# Altium project Industrial_IOT_Dev_Brd-v1.0.PrjPcb (part 7 of 7)
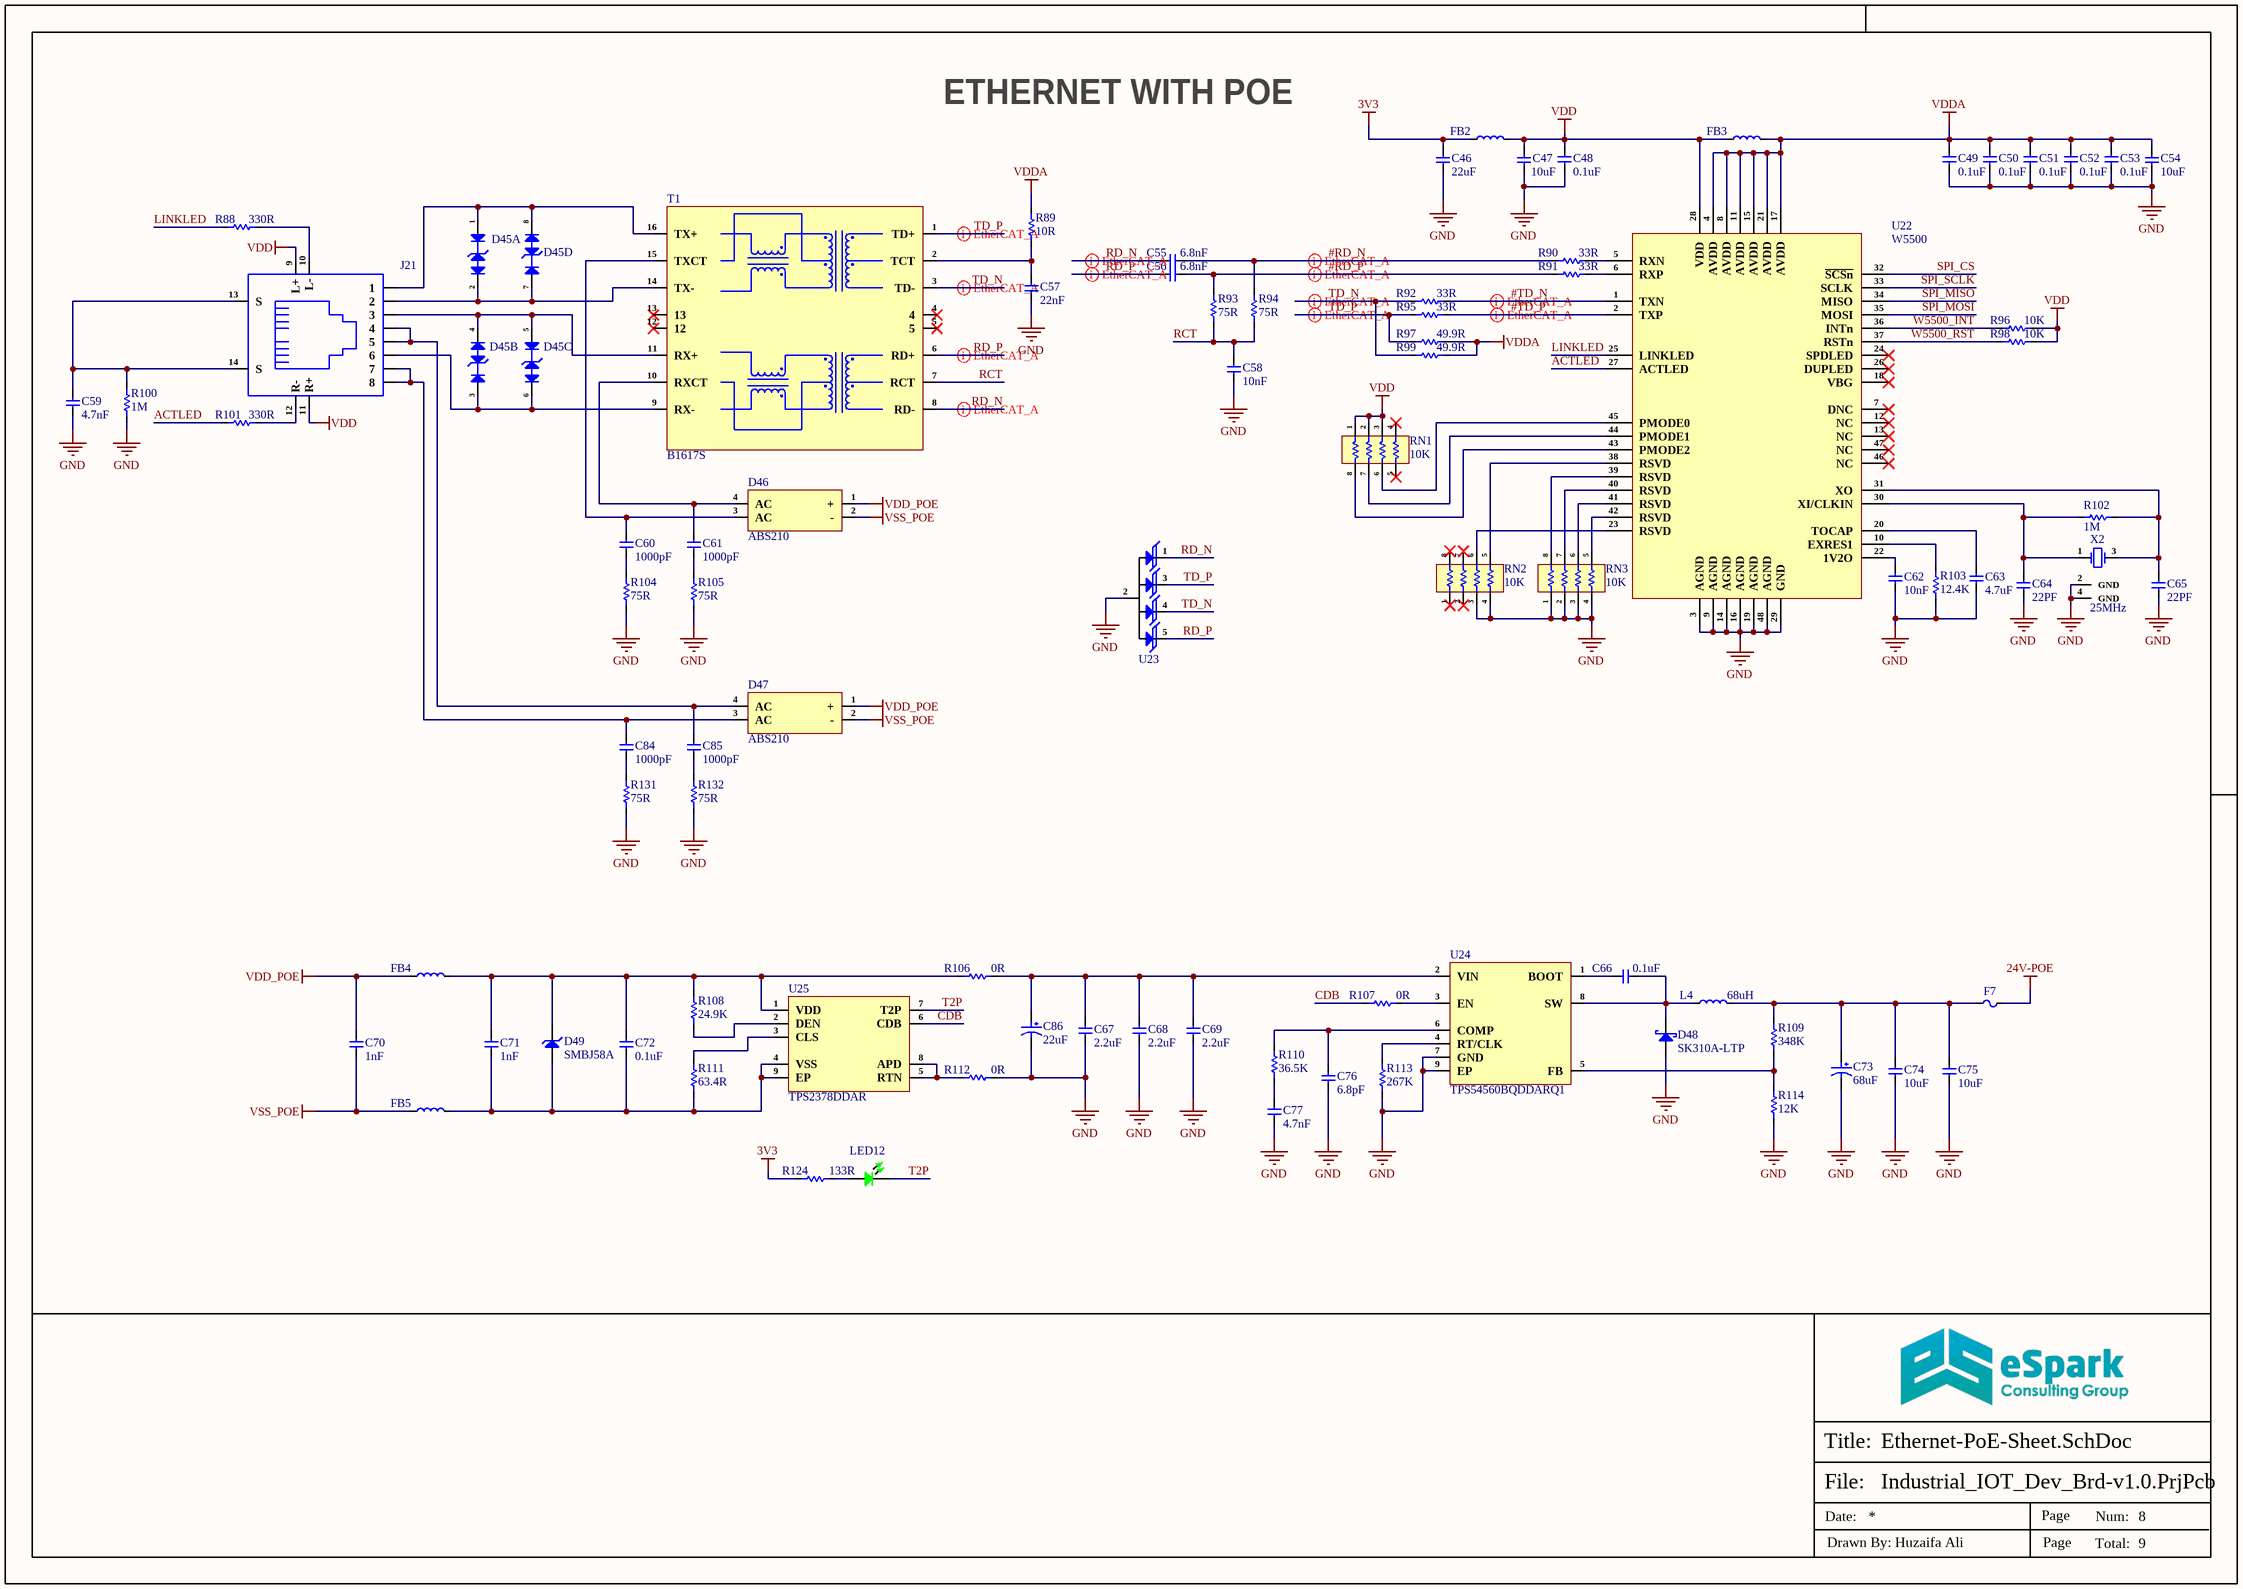
[diagram p12: Ethernet-PoE-Sheet.SchDoc]

## Sheet Ethernet-PoE-Sheet.SchDoc (continued)

### Library data of the parts (continued)
R102 = RK73H1ETTP1004F: Res Thick Film 0402 1M Ohm 1% 0.1W(1/10W) ±100ppm/C Pad SMD Automotive T/R; Manufacturer: KOA Speer; Resistance: 1MR; Power Rating: 63mW; Voltage Rating: 50V; Temperature Coefficient: 100ppm/°C; Max Power Dissipation: 100mW; Item Type: Resistor; Supplier 1: Rs; Manufacturer Part Number: RK73H1ETTP1004F; RoHS: Yes; Category: Chip SMD Resistors; Stock 1: 29500; Pricing 1: 100=0.003, 1000=0.006, 2500=0.005, 5000=0.005, 10000=0.004 (GBP); Mount: Surface Mount; Case/Package: 0402; Case Code (Imperial): 0402; Case Code (Metric): 1005; Min Operating Temperature: -55°C; Max Operating Temperature: 155°C; Packaging: Tape and Reel; Tolerance: 1%; Package Quantity: 10000; Termination: SMD/SMT; Series: RK73H; Construction: Rectangular; Technology: THICK FILM; Features: Moisture Resistant,Automotive AEC-Q200; Number of Terminations: 2; Voltage Rating (DC): 50V; Length: 1mm; Width: 0.5mm; Height: 0.35mm; Depth: 0.5mm; Ratings: AEC-Q200; Military Standard: Not; RoHS Compliant: Yes; Lead Free: 5697LeadFree; ComponentLink1URL: http://www.jameco.com/Jameco/Products/ProdDS/1882463.pdf?src-supplier=Jameco; ComponentLink1Description: http://www.jameco.com/Jameco/Products/ProdDS/1882463.pdf?src-supplier=Jameco; ComponentLink2URL: http://components.arrow.com/part/dataview/39721833S6492602N5146?src-supplier=Arrow+Electronics; ComponentLink2Description: http://components.arrow.com/part/dataview/39721833S6492602N5146?src-supplier=Arrow+Electronics; ComponentLink3URL: https://datasheet.octopart.com/RK73H1ETTP1004F-KOA-Speer-datasheet-149653815.pdf?src-supplier=Farnell; ComponentLink3Description: https://datasheet.octopart.com/RK73H1ETTP1004F-KOA-Speer-datasheet-149653815.pdf?src-supplier=Farnell; ComponentLink4URL: http://www.koaspeer.com/catimages/Products/RK73H/RK73H.pdf?src-supplier=Mouser; ComponentLink4Description: http://www.koaspeer.com/catimages/Products/RK73H/RK73H.pdf?src-supplier=Mouser; ComponentLink5URL: https://www.verical.com/server-webapp/html/getDatasheet?partID=139303&src-supplier=Verical; ComponentLink5Description: https://www.verical.com/server-webapp/html/getDatasheet?partID=139303&src-supplier=Verical; LCSC Part Number: C159943
R103 = RC0603FR-0712K4L: RES SMD 12.4K OHM 1% 1/10W 0603; Manufacturer: Yageo; Resistance: 12.4kR; Power Rating: 100mW; Voltage Rating: 50V; Temperature Coefficient: 100ppm/°C; Working Voltage: 75V; Supplier 1: Digi-Key; Manufacturer Part Number: RC0603FR-0712K4L; RoHS: Yes; Category: Chip SMD Resistors; Stock 1: 494008; Pricing 1: 1=0.10000, 10=0.02400, 100=0.00970, 1000=0.00436, 2500=0.00378 (USD); Case/Package: 0603; Case Code (Metric): 1608; Case Code (Imperial): 0603; Min Operating Temperature: -55°C; Max Operating Temperature: 155°C; Packaging: Tape and Reel; Tolerance: 1%; Package Quantity: 1; Resistor Type: Thick Film; Number of Terminations: 2; Termination: SMD/SMT; Max Power Dissipation: 100mW; Voltage Rating (DC): 50V; Features: Moisture Resistant; Series: RC; Construction: Rectangular; Technology: THICK FILM; Length: 0.063inch; Width: 0.031inch; Height: 0.022inch; Depth: 0.8mm; Military Standard: Not; Lead Free: Lead Free; RoHS Compliant: Yes; ComponentLink1URL: https://datasheet.ciiva.com/2454/pyu-r-int-thick-7-2454069.pdf?src-supplier=Digi-Key; ComponentLink1Description: https://datasheet.ciiva.com/2454/pyu-r-int-thick-7-2454069.pdf?src-supplier=Digi-Key; ComponentLink2URL: https://datasheet.ciiva.com/2454/pyu-r-int-thick-7-2454070.pdf?src-supplier=Digi-Key; ComponentLink2Description: https://datasheet.ciiva.com/2454/pyu-r-int-thick-7-2454070.pdf?src-supplier=Digi-Key; ComponentLink3URL: https://datasheet.ciiva.com/2454/pyu-r-int-thick-7-2454071.pdf?src-supplier=Digi-Key; ComponentLink3Description: https://datasheet.ciiva.com/2454/pyu-r-int-thick-7-2454071.pdf?src-supplier=Digi-Key; Supplier Part Number 1: 311-12.4KHRCT-ND; LCSC Part Number: C137798
R106 R112 = RC0805FR-070RL: RES 0 OHM JUMPER 1/8W 0805; Manufacturer: Yageo; Resistance: 0mR; Tolerance: 1%; Power Rating: 125mW; Item Type: Resistor; Supplier 1: Avnet; Manufacturer Part Number: RC0805FR-070RL; RoHS: Yes; Category: Chip SMD Resistors; Stock 1: 85000; Pricing 1: 5000=0.00281, 10000=0.00277, 20000=0.00269 (USD); Case/Package: 0805; Contact Plating: Tin,Matte; Case Code (Imperial): 0805; Case Code (Metric): 2012; Size Code: 0805; Min Operating Temperature: -55°C; Max Operating Temperature: 155°C; Resistor Type: Thick Film; Packaging: Tape and Reel; Features: Moisture Resistant; Series: RC; Max Power Dissipation: 125mW; Number of Terminations: 2; Construction: Rectangular; Length: 2mm; Depth: 1.25mm; Radiation Hardening: No; Military Standard: Not; Lead Free: Lead Free; RoHS Compliant: Yes; ComponentLink1URL: https://datasheet.ciiva.com/15189/getdatasheetpartid-348154-15189885.pdf?src-supplier=Verical; ComponentLink1Description: https://datasheet.ciiva.com/15189/getdatasheetpartid-348154-15189885.pdf?src-supplier=Verical; ComponentLink2URL: https://datasheet.ciiva.com/17042/rc0805-17042698.pdf?src-supplier=Future+Electronics; ComponentLink2Description: https://datasheet.ciiva.com/17042/rc0805-17042698.pdf?src-supplier=Future+Electronics; Supplier Part Number 1: RC0805FR-070RL; LCSC Part Number: C100045
R107 = RC0402FR-070RL: RES 0 OHM JUMPER 1/16W 0402; Manufacturer: Yageo; Item Type: Resistors; Tolerance: 1%; Power Rating: 62.5mW; Voltage Rating: 50V; Temperature Coefficient: 200ppm/°C; Max Power Dissipation: 63mW; Supplier 1: Mouser; Manufacturer Part Number: RC0402FR-070RL; RoHS: Yes; Stock 1: 8556842; Pricing 1: 1=0.10000, 10=0.01400, 50=0.01400, 100=0.00600, 1000=0.00300, 5000=0.00200, 10000=0.00100 (USD); Mount: Surface Mount; Case/Package: 0402; Contact Plating: Tin,Matte; Case Code (Imperial): 0402; Case Code (Metric): 1005; Size Code: 0402; Min Operating Temperature: -55°C; Max Operating Temperature: 155°C; Resistance: 0R; Resistor Type: Thick Film; Packaging: Tape and Reel; Termination: SMD/SMT; Features: Moisture Resistant; Series: RC; Number of Terminations: 2; Length: 1mm; Width: 0.5mm; Height: 0.35mm; Radiation Hardening: No; Lead Free: Lead Free; RoHS Compliant: Yes; ComponentLink1URL: https://datasheet.ciiva.com/8896/pyu-rc0402-51-rohs-l-6-8896149.pdf?src-supplier=Avnet; ComponentLink1Description: https://datasheet.ciiva.com/8896/pyu-rc0402-51-rohs-l-6-8896149.pdf?src-supplier=Avnet; ComponentLink2URL: https://datasheet.ciiva.com/16790/pyu-rc0402-51-rohs-l-6-r-16790444.pdf?src-supplier=Future+Electronics; ComponentLink2Description: https://datasheet.ciiva.com/16790/pyu-rc0402-51-rohs-l-6-r-16790444.pdf?src-supplier=Future+Electronics; Supplier Part Number 1: 603-RC0402FR-070RL; LCSC Part Number: C106231
R108 = 0603WAF2492T5E: 100mW Thick Film Resistors 75V ±100ppm/℃ ±1% 24.9kΩ 0603 Chip Resistor - Surface Mount ROHS; Manufacturer: UNI-ROYAL(Uniroyal Elec); Manufacturer Part Number: 0603WAF2492T5E; Package: 0603; LCSC Part Number: C25962; Item Type: Resistor; ComponentLink1Description: LCSC; ComponentLink1URL: https://www.lcsc.com/product-detail/Chip-Resistor-Surface-Mount_UNI-ROYAL-Uniroyal-Elec-0603WAF2492T5E_C25962.html
R109 = RT0805BRD07348KL: RES SMD 348K OHM 0.1% 1/8W 0805; Manufacturer: Yageo; Item Type: Resistors; Value: 348kR; Voltage Rating: 150V; Power Rating: 125mW; Temperature Coefficient: 25ppm/°C; Supplier: Digikey; LCSC Part Number: C865416; Manufacturer Part Number: RT0805BRD07348KL; RoHS: Yes; Stock: 10028; Pricing: 1=0.16, 10=0.122, 50=0.0968, 100=0.0867, 500=0.06936, 1000=0.05814 (USD); Case/Package: 0805; Case Code (Metric): 2012; Case Code (Imperial): 0805; Min Operating Temperature: -55°C; Max Operating Temperature: 155°C; Tolerance: 0.1%; Packaging: Tape and Reel; Termination: SMD/SMT; Voltage Rating (DC): 150V; Series: RT; Max Power Dissipation: 125mW; Number of Terminations: 2; Width: 1.25mm; RoHS Compliant: Yes; ComponentLink1URL: https://datasheet.ciiva.com/12705/pyu-rt-1-to-0-05-rohs-l-4-12705227.pdf?src-supplier=Mouser; ComponentLink1Description: https://datasheet.ciiva.com/12705/pyu-rt-1-to-0-05-rohs-l-4-12705227.pdf?src-supplier=Mouser
R110 = RC0603FR-0736K5L: RES 36.5K OHM 1% 1/10W 0603; Manufacturer: YAGEO; Item Type: Resistor; Manufacturer Part Number: RC0603FR-0736K5L; Package: 0603; LCSC Part Number: C137738; ComponentLink1Description: LCSC; ComponentLink1URL: https://www.lcsc.com/product-detail/Chip-Resistor-Surface-Mount_YAGEO-RC0603FR-0736K5L_C137738.html
R111 = AC0603FR-0763R4L: RES SMD 63.4 OHM 1% 1/10W 0603; Manufacturer: Yageo; Item Type: Resistor; Power Rating: 100mW; Voltage Rating: 50V; Temperature Coefficient: 100ppm/°C; Supplier: Digikey; LCSC Part Number: C228004; Manufacturer Part Number: AC0603FR-0763R4L; RoHS: Yes; Stock: 4788; Pricing: 1=0.1, 10=0.021, 50=0.013, 100=0.0108, 500=0.00734, 1000=0.00633 (USD); Case/Package: 0603; Case Code (Imperial): 0603; Case Code (Metric): 1608; Weight: 7.1E-05oz; Min Operating Temperature: -55°C; Max Operating Temperature: 155°C; Tolerance: 1%; Value: 63.4R; Packaging: Tape and Reel; Termination: SMD/SMT; Number of Terminations: 2; Max Power Dissipation: 100mW; Features: Moisture Resistant,Automotive AEC-Q200; Series: AC; Length: 0.063inch; Width: 0.8mm; Height: 0.022inch; RoHS Compliant: Yes; ComponentLink1URL: https://datasheet.ciiva.com/12576/pyu-ac-51-rohs-l-2-12576614.pdf?src-supplier=Mouser; ComponentLink1Description: https://datasheet.ciiva.com/12576/pyu-ac-51-rohs-l-2-12576614.pdf?src-supplier=Mouser
R113 = RT0603BRD07267KL: RES SMD 267K OHM 0.1% 1/10W 0603; Manufacturer: Yageo; Item Type: Resistors; Value: 267kR; Power Rating: 100mW; Voltage Rating: 75V; Temperature Coefficient: 25ppm/°C; Voltage Rating (DC): 50V; Supplier: Digikey; LCSC Part Number: C705753; Manufacturer Part Number: RT0603BRD07267KL; RoHS: Yes; Stock: 12053; Pricing: 1=0.15, 10=0.106, 50=0.0846, 100=0.0755, 500=0.05814, 1000=0.051 (USD); Case/Package: 0603; Case Code (Imperial): 0603; Case Code (Metric): 1608; Weight: 7.1E-05oz; Min Operating Temperature: -55°C; Max Operating Temperature: 155°C; Packaging: Tape and Reel; Tolerance: 0.1%; Termination: SMD/SMT; Series: RT; Max Power Dissipation: 100mW; Number of Terminations: 2; Length: 1.6mm; Width: 0.8mm; Height: 0.45mm; Lead Free: Lead Free; RoHS Compliant: Yes; ComponentLink1URL: http://www.mouser.com/ds/2/447/yageodocoutput-1125656.pdf?src-supplier=Mouser; ComponentLink1Description: http://www.mouser.com/ds/2/447/yageodocoutput-1125656.pdf?src-supplier=Mouser; ComponentLink2URL: http://www.yageo.com/documents/recent/PYu-RT_1-to-0.01_RoHS_L_9.pdf?src-supplier=Digikey; ComponentLink2Description: http://www.yageo.com/documents/recent/PYu-RT_1-to-0.01_RoHS_L_9.pdf?src-supplier=Digikey
R114 = RC0603FR-0712KL: RES 12K OHM 1% 1/10W 0603; Manufacturer: Yageo; Value: 12kR; Power Rating: 100mW; Voltage Rating (DC): 50V; Temperature Coefficient: 100ppm/°C; Item Type: Resistor; Supplier: Future Electronics; Supplier Part Number: 6276984; Manufacturer Part Number: RC0603FR-0712KL; RoHS: Yes; Category: Chip SMD Resistors; Stock: 15340000; Pricing: 5000=0.0028, 75000=0.0015, 100000=0.0026, 250000=0.0014, 375000=0.0025, 750000=0.0013, 1250000=0.0024, 2500000=0.0012, 5000000=0.0022 (USD); Case/Package: 0603; Pins: 2; Case Code (Imperial): 0603; Case Code (Metric): 1608; Min Operating Temperature: -55°C; Max Operating Temperature: 155°C; Tolerance: 1%; Packaging: Tape and Reel; Resistor Type: Thick Film; Voltage Rating: 50V; Termination: SMD/SMT; Number of Terminations: 2; Max Power Dissipation: 100mW; Features: Moisture Resistant; Series: RC; Construction: Rectangular; Resistance Tolerance: 1%; Length: 1.6mm; Width: 0.8mm; Depth: 0.8mm; Reach SVHC Compliant: No; RoHS Compliant: Yes; Lead Free: 5697LeadFree; Military Standard: Not; ComponentLink1URL: https://datasheet.ciiva.com/46412/443971-46412842.pdf?src-supplier=Element14; ComponentLink1Description: https://datasheet.ciiva.com/46412/443971-46412842.pdf?src-supplier=Element14; ComponentLink2URL: https://datasheet.ciiva.com/2454/pyu-r-int-thick-7-2454283.pdf?src-supplier=Digikey; ComponentLink2Description: https://datasheet.ciiva.com/2454/pyu-r-int-thick-7-2454283.pdf?src-supplier=Digikey; ComponentLink3URL: https://datasheet.ciiva.com/2454/pyu-r-int-thick-7-2454284.pdf?src-supplier=Digikey; ComponentLink3Description: https://datasheet.ciiva.com/2454/pyu-r-int-thick-7-2454284.pdf?src-supplier=Digikey; ComponentLink4URL: https://datasheet.ciiva.com/2454/pyu-r-int-thick-7-2454282.pdf?src-supplier=Digikey; ComponentLink4Description: https://datasheet.ciiva.com/2454/pyu-r-int-thick-7-2454282.pdf?src-supplier=Digikey; ComponentLink5URL: https://datasheet.ciiva.com/7746/1784430-7746250.pdf?src-supplier=Element14; ComponentLink5Description: https://datasheet.ciiva.com/7746/1784430-7746250.pdf?src-supplier=Element14; ComponentLink6URL: https://datasheet.ciiva.com/7746/1784430-7746251.pdf?src-supplier=Element14; ComponentLink6Description: https://datasheet.ciiva.com/7746/1784430-7746251.pdf?src-supplier=Element14; LCSC Part Number: C114659
R124 = RC0402FR-07133RL: RES 133 OHM 1% 1/16W 0402; Manufacturer: Yageo; Temperature Coefficient: 100ppm/°C; Power Rating: 62.5mW; Voltage Rating: 50V; Max Power Dissipation: 63mW; Supplier 1: Mouser; Manufacturer Part Number: RC0402FR-07133RL; RoHS: Yes; Category: Chip SMD Resistors; Stock 1: 12475; Pricing 1: 1=0.10000, 10=0.01200, 50=0.01200, 100=0.00500, 1000=0.00300, 2500=0.00200, 10000=0.00100 (USD); Case/Package: 0402; Contact Plating: Tin,Matte; Case Code (Imperial): 0402; Case Code (Metric): 1005; Size Code: 0402; Min Operating Temperature: -55°C; Max Operating Temperature: 155°C; Tolerance: 1%; Resistance: 133R; Resistor Type: Thick Film; Packaging: Tape and Reel; Number of Terminations: 2; Termination: SMD/SMT; Features: Moisture Resistant; Series: RC; Construction: Rectangular; Length: 1mm; Width: 0.02inch; Height: 0.016inch; Depth: 0.5mm; Military Standard: Not; Lead Free: Lead Free; RoHS Compliant: Yes; ComponentLink1URL: https://datasheet.ciiva.com/8887/pyu-rc0402-51-rohs-l-6-8887451.pdf?src-supplier=Avnet; ComponentLink1Description: https://datasheet.ciiva.com/8887/pyu-rc0402-51-rohs-l-6-8887451.pdf?src-supplier=Avnet; Supplier Part Number 1: 603-RC0402FR-07133RL; LCSC Part Number: C327373
RN1-RN3 = YC164-FR-0710KL: RES ARRAY 4 RES 10K OHM 1206; Manufacturer: Yageo; Tolerance: 1%; Voltage Rating: 50V; Number of Elements: 4; Value: 10kR; Circuit Type: Isolated; Power Per Element: 62.5mW; Temperature Coefficient: 200ppm/°C; Item Type: Resistor Array; Supplier 1: Future Electronics; Manufacturer Part Number: YC164-FR-0710KL; RoHS: Yes; Category: Resistor Arrays; Stock 1: 25000; Pricing 1: 5000=0.0101, 20000=0.0095, 50000=0.0092, 125000=0.0089, 200000=0.0085 (USD); Mounting Technology: Surface Mount; Pins: 8; Case Code (Metric): 3216; Case Code (Imperial): 1206; Min Operating Temperature: -55°C; Max Operating Temperature: 155°C; Packaging: Tape and Reel; Number of Resistors: 4; Number of Circuits: 4; Series: YC164; Resistance Tolerance: 1%; Length: 0.126inch; Width: 0.063inch; Height: 0.028inch; Lead Free: Lead Free; RoHS Compliant: Yes; Reach SVHC Compliant: Unknown; ComponentLink1URL: http://www.farnell.com/datasheets/2167431.pdf?src-supplier=Farnell; ComponentLink1Description: http://www.farnell.com/datasheets/2167431.pdf?src-supplier=Farnell; ComponentLink2URL: https://media.digikey.com/pdf/Data%20Sheets/Yageo%20PDFs/YC102-358,TC122-164_Series_DS.pdf?src-supplier=Digi-Key; ComponentLink2Description: https://media.digikey.com/pdf/Data%20Sheets/Yageo%20PDFs/YC102-358,TC122-164_Series_DS.pdf?src-supplier=Digi-Key; ComponentLink3URL: http://www.farnell.com/datasheets/2167431.pdf?src-supplier=Element14; ComponentLink3Description: http://www.farnell.com/datasheets/2167431.pdf?src-supplier=Element14; ComponentLink4URL: http://www.farnell.com/datasheets/443424.pdf?src-supplier=Element14; ComponentLink4Description: http://www.farnell.com/datasheets/443424.pdf?src-supplier=Element14; ComponentLink5URL: http://www.farnell.com/datasheets/2167431.pdf?src-supplier=Newark; ComponentLink5Description: http://www.farnell.com/datasheets/2167431.pdf?src-supplier=Newark; Supplier Part Number 1: 5054288; LCSC Part Number: C110924
T1 = B1617S: Single port 1:1 100M POE SMD-16P,12.7x7mm Pulse Transformers(LAN) ROHS; Manufacturer: CND-tek; Manufacturer Part Number: B1617S; Package: SMD-16P,12.7x7mm; LCSC Part Number: C507597; Item Type: Transformer; ComponentLink1Description: LCSC; ComponentLink1URL: https://jlcpcb.com/partdetail/cndtek-B1617S/C507597
U22 = W5500: SPI LQFP-48(7x7) Ethernet ICs ROHS; Manufacturer: WIZNET; Item Type: IC; Manufacturer Part Number: W5500; LCSC Part Number: C32843; Package: LQFP-48(7x7); ComponentLink1Description: LCSC; ComponentLink1URL: https://www.lcsc.com/product-detail/Ethernet-ICs_WIZNET-W5500_C32843.html
U23 = SP0504BAHTG: TVS DIODE 5.5VWM 8.5VC SOT23-5; Manufacturer: Littelfuse; Direction: Unidirectional; Value: 30pF; Number of Channels: 4; Polarity: Bidirectional,Unidirectional; Breakdown Voltage: 5.5V; Clamping Voltage: 7.8V; Max Power Dissipation: 225mW; Power Line Protection: No; Leakage Current: 100nA; ESD Protection: Yes; Voltage Rating (DC): 5V; Diode Type: ZENER; Clamping Voltage-Max: 8V; Supplier 1: Future Electronics; Manufacturer Part Number: SP0504BAHTG; RoHS: Yes; Category: TVS Diodes; Stock 1: 1611; Pricing 1: 1=0.78, 15=0.685, 75=0.625, 300=0.575, 1500=0.52 (USD); Mounting Technology: Surface Mount; Case/Package: SOT-23; Pins: 5; Min Operating Temperature: -40°C; Max Operating Temperature: 85°C; Packaging: Tape and Reel; Termination: SMD/SMT; Working Voltage: 5.5V; Number of Unidirectional Channels: 4; Reverse Standoff Voltage: 5.5V; Number of Elements: 4; Peak Pulse Power: 225mW; Max Reverse Leakage Current: 100nA; Power Dissipation: 225mW; Series: SP05, SPA®; Length: 3.05mm; Width: 1.75mm; Height: 1.3mm; Depth: 1.75mm; Radiation Hardening: No; Lead Free: Lead Free; RoHS Compliant: Yes; Reach SVHC Compliant: Unknown; ComponentLink1URL: https://datasheet.ciiva.com/15143/getdatasheetpartid-152299-15143806.pdf?src-supplier=Verical; ComponentLink1Description: https://datasheet.ciiva.com/15143/getdatasheetpartid-152299-15143806.pdf?src-supplier=Verical; ComponentLink2URL: https://datasheet.ciiva.com/4509/sp05x-leadfree-4509638.pdf?src-supplier=Mouser; ComponentLink2Description: https://datasheet.ciiva.com/4509/sp05x-leadfree-4509638.pdf?src-supplier=Mouser; ComponentLink3URL: https://datasheet.ciiva.com/22697/1911798-22697943.pdf?src-supplier=Element14; ComponentLink3Description: https://datasheet.ciiva.com/22697/1911798-22697943.pdf?src-supplier=Element14; ComponentLink4URL: https://datasheet.ciiva.com/8062/littefuse-spa-sp050x-8062425.pdf?src-supplier=Element14; ComponentLink4Description: https://datasheet.ciiva.com/8062/littefuse-spa-sp050x-8062425.pdf?src-supplier=Element14; ComponentLink5URL: https://datasheet.ciiva.com/332/sp05xxba-332619.pdf?src-supplier=Digi-Key; ComponentLink5Description: https://datasheet.ciiva.com/332/sp05xxba-332619.pdf?src-supplier=Digi-Key; ComponentLink6URL: https://datasheet.ciiva.com/332/sp05xxba-332620.pdf?src-supplier=Digi-Key; ComponentLink6Description: https://datasheet.ciiva.com/332/sp05xxba-332620.pdf?src-supplier=Digi-Key; ComponentLink7URL: https://datasheet.ciiva.com/16393/sp05xxba-16393404.pdf?src-supplier=Future+Electronics; ComponentLink7Description: https://datasheet.ciiva.com/16393/sp05xxba-16393404.pdf?src-supplier=Future+Electronics; ComponentLink8URL: https://datasheet.ciiva.com/332/sp05xxba-332621.pdf?src-supplier=Digi-Key; ComponentLink8Description: https://datasheet.ciiva.com/332/sp05xxba-332621.pdf?src-supplier=Digi-Key; ComponentLink9URL: https://datasheet.ciiva.com/1268/526672-1268494.pdf?src-supplier=Element14; ComponentLink9Description: https://datasheet.ciiva.com/1268/526672-1268494.pdf?src-supplier=Element14; Supplier Part Number 1: 3283009; LCSC Part Number: C10675; Item Type: TVS Diode
U24 = TPS54560BQDDARQ1: IC REG BCK SPLIT RAIL ADJ 8SOPWR; Manufacturer: Texas Instruments; Max Supply Voltage: 60V; Min Supply Voltage: 4.5V; Nominal Supply Current: 146uA; Supplier: Mouser; Supplier Part Number: 595-TPS54560BQDDARQ1; Manufacturer Part Number: TPS54560BQDDARQ1; RoHS: Yes; Item Type: IC; Stock: 1171; Pricing: 1=6.41, 10=5.44, 50=5.44, 100=4.7, 1000=3.4, 10000=3.29 (USD); Length: 4.89mm; Width: 3.9mm; Height: 1.7mm; Thickness: 1.48mm; ComponentLink1URL: http://www.ti.com/lit/ds/symlink/tps54560b-q1.pdf?src-supplier=Digikey; ComponentLink1Description: http://www.ti.com/lit/ds/symlink/tps54560b-q1.pdf?src-supplier=Digikey; LCSC Part Number: C2072188
U25 = TPS2378DDAR: IEEE 802.3at PoE High-Power PD interface with AUX Control 8-SO PowerPAD -40 to 85; Manufacturer: Texas Instruments; Item Type: IC; Supplier: Mouser; Supplier Part Number: 595-TPS2378DDAR; Manufacturer Part Number: TPS2378DDAR; RoHS: Yes; Category: Interface ICs; Stock: 2078; Pricing: 1=1.61, 10=1.08, 50=1.08, 100=0.955, 1000=0.801, 10000=0.664 (USD); Width: 3.9mm; Thickness: 1.48mm; Lead Free: 5697LeadFree; ComponentLink1URL: https://datasheet.ciiva.com/6632/tps2378-6632081.pdf?src-supplier=Digikey; ComponentLink1Description: https://datasheet.ciiva.com/6632/tps2378-6632081.pdf?src-supplier=Digikey; ComponentLink2URL: https://datasheet.ciiva.com/26931/getdatasheetpartid-621225-26931136.pdf?src-supplier=Verical; ComponentLink2Description: https://datasheet.ciiva.com/26931/getdatasheetpartid-621225-26931136.pdf?src-supplier=Verical; LCSC Part Number: C337500
X2 = X322525MRB4SI: 25MHz 贴片晶振 18pF ±10ppm ±20ppm SMD3225-4P Crystals ROHS; Manufacturer: YXC; Supplier: LCSC; LCSC Part Number: C70593; Manufacturer Part Number: X322525MRB4SI; RoHS: No; Item Type: Crystal

## Sheet RS485-Sheet.SchDoc
size 420 x 297 mm; SheetNumber: 9; SheetTotal: 9
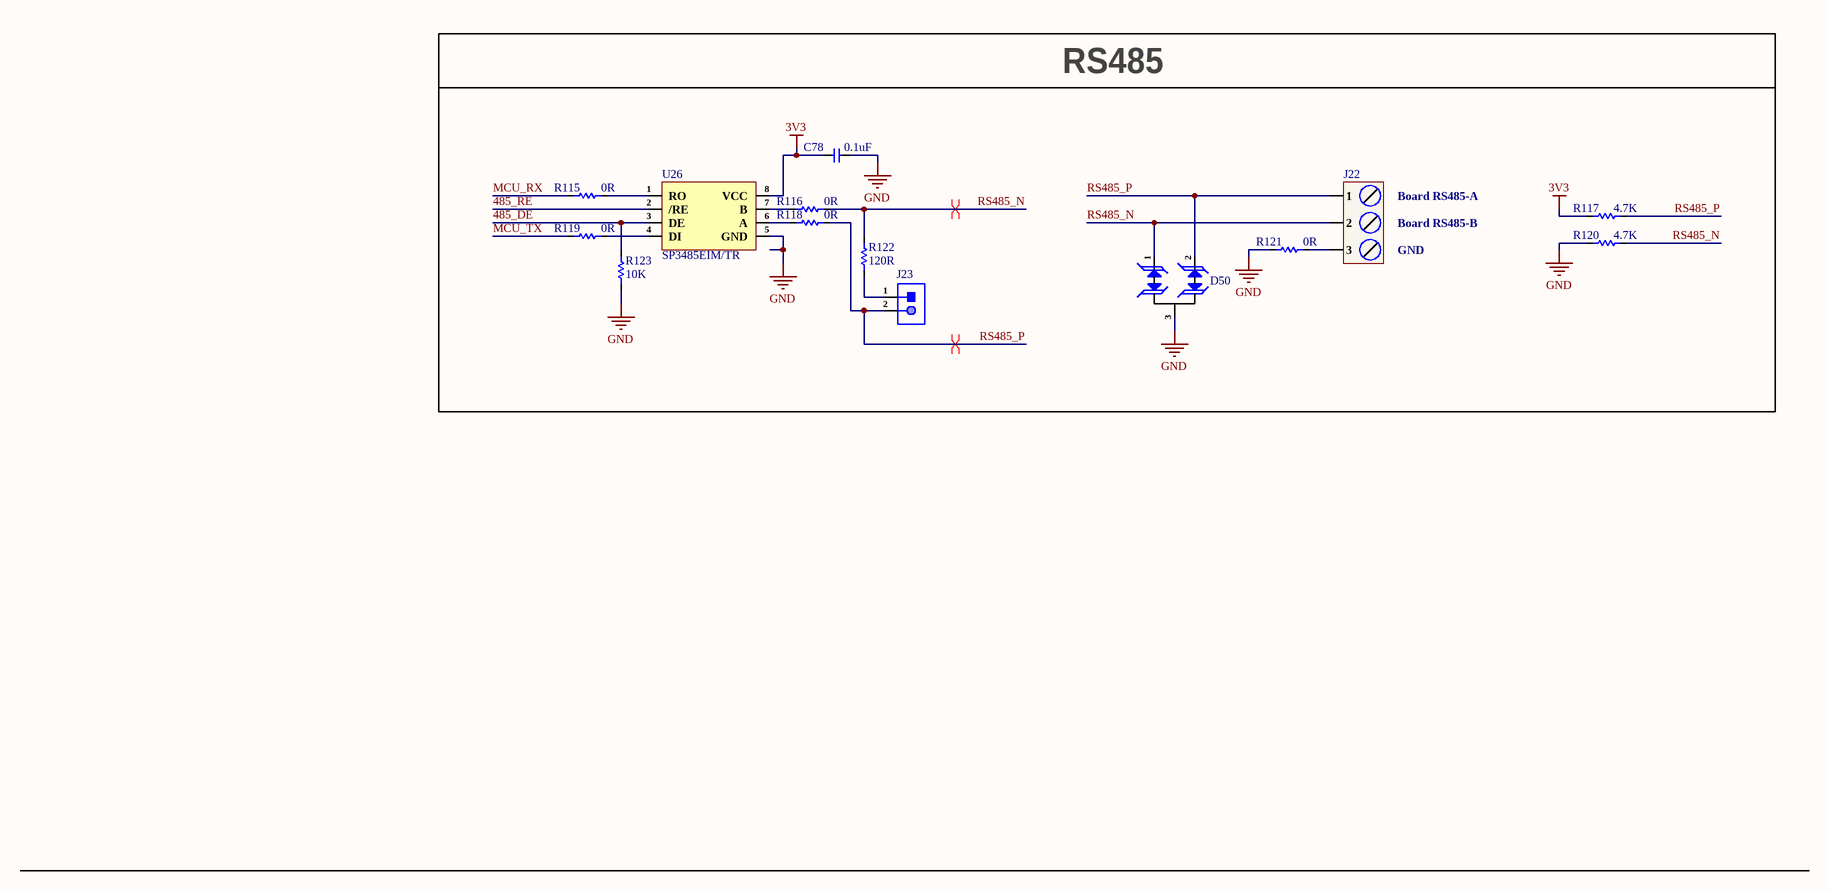
[diagram p8: RS485-Sheet.SchDoc]

### Parts
C78  0.1uF  [Cap-0402]
D50  SM712  [SOT-23]  (value not drawn)
J22  DB128L-5.08-3P-GN-S  [DB128L-5.08-3P-GN-S]  (value not drawn)
J23  X6511WV-02H-C60D30  [HDR1X2_]  (value not drawn)
R115  0R  [Res-0402]
R116  0R  [Res-0402]
R117  4.7K  [Res-0402]
R118  0R  [Res-0402]
R119  0R  [Res-0402]
R120  4.7K  [Res-0402]
R121  0R  [Res-0402]
R122  120R  [Res-0603]
R123  10K  [Res-0402]
U26  SP3485EIM/TR  [SOP-8]

### Nets
3V3: C78.1 R117.1 U26.8(VCC)
GND: C78.2 D50.3(GND) R120.1 R121.1 R123.2 U26.5(GND)
485_DE: R123.1 U26.3(DE)
485_RE: U26.2(/RE)
MCU_RX: R115.1
MCU_TX: R119.1
RS485_N: D50.1(I/O1) J22.2 R116.2 R120.2 R122.2
RS485_P: D50.2(I/O2) J22.1 J23.2 R117.2 R118.2
NetJ22_3: J22.3 R121.2
NetJ23_1: J23.1 R122.1
NetR115_2: R115.2 U26.1(RO)
NetR116_1: R116.1 U26.7(B)
NetR118_1: R118.1 U26.6(A)
NetR119_2: R119.2 U26.4(DI)

### Layout directives
differential pair; differential pair class RS485: RS485_N, RS485_P

### Notes on the sheet
- RS485
- Board RS485-A
- Board RS485-B
- GND
- File:
- Title:
- Date:
- Page
- Num:
- Total:
- Drawn By: Huzaifa Ali

### Library data of the parts
C78 = CC0402JRX7R7BB104: as C48-C53 on sheet Ethernet-PoE-Sheet; Supplier: Digikey; Supplier Part Number: 311-1676-1-ND; Manufacturer Part Number: CC0402JRX7R7BB104; RoHS: Yes; Category: Ceramic Capacitors; Stock: 1659111; Pricing: 1=0.1, 10=0.046, 50=0.0262, 100=0.0203, 500=0.01528, 1000=0.012, 2500=0.01091, 5000=0.01004 (USD); Mounting Technology: Surface Mount; Case/Package: 0402; Case Code (Metric): 1005; Case Code (Imperial): 0402; Min Operating Temperature: -55°C; Max Operating Temperature: 125°C; Dielectric: X7R; Packaging: Tape and Reel; Package Quantity: 10000; Voltage Rating (DC): 16V; Voltage Rating: 16V; Series: CC; Construction: Flat; Length: 0.039inch; Width: 0.02inch; Height: 0.5mm; Thickness: 0.022inch; Lead Free: Lead Free; Halogen Free: Halogen Free; RoHS Compliant: Yes; ComponentLink1URL: https://datasheet.ciiva.com/13210/upy-gphc-x7r-6-3v-to-50v-8-12304-13210152.pdf?src-supplier=Mouser; ComponentLink1Description: https://datasheet.ciiva.com/13210/upy-gphc-x7r-6-3v-to-50v-8-12304-13210152.pdf?src-supplier=Mouser; LCSC Part Number: C541464
D50 = SM712: SOT-23 TVS ROHS; Manufacturer: TECH PUBLIC; Item Type: Diode; Manufacturer Part Number: SM712; Package: SOT-23; LCSC Part Number: C521963; ComponentLink1Description: LCSC; ComponentLink1URL: https://www.lcsc.com/product-detail/TVS_TECH-PUBLIC-SM712_C521963.html
J22 = DB128L-5.08-3P-GN-S: 1x3P 18A -40℃~+105℃ 250V Green 12~30 Direct Insert 5.08mm 2.5 1 3 Plugin,P=5.08mm Screw Terminal Blocks ROHS; Manufacturer: DORABO; Manufacturer Part Number: DB128L-5.08-3P-GN-S; Package: Plugin,P=5.08mm; LCSC Part Number: C395869; Item Type: Terminal Block; ComponentLink1Description: LCSC; ComponentLink1URL: https://www.lcsc.com/product-detail/Screw-Terminal-Blocks_DORABO-DB128L-5-08-3P-GN-S_C395869.html
J23 = X6511WV-02H-C60D30: Gold 250V 3A Straight Square Pins 2.5mm 2P 260℃ 6mm -40℃~+105℃ 3mm 2.54mm Plugin Black Brass 1x2P Plugin,P=2.54mm Pin Headers ROHS; Manufacturer: XKB; Item Type: Male Header; Manufacturer Part Number: X6511WV-02H-C60D30; Package: Plugin,P=2.54mm; LCSC Part Number: C706874; ComponentLink1Description: LCSC; ComponentLink1URL: https://www.lcsc.com/product-detail/Pin-Headers_XKB-Connectivity-X6511WV-02H-C60D30_C706874.html
R115 R116 R118 R119 R121 = RC0402FR-070RL: as R107 on sheet Ethernet-PoE-Sheet; Supplier 1: Mouser; Manufacturer Part Number: RC0402FR-070RL; RoHS: Yes; Stock 1: 8556842; Pricing 1: 1=0.10000, 10=0.01400, 50=0.01400, 100=0.00600, 1000=0.00300, 5000=0.00200, 10000=0.00100 (USD); Mount: Surface Mount; Case/Package: 0402; Contact Plating: Tin,Matte; Case Code (Imperial): 0402; Case Code (Metric): 1005; Size Code: 0402; Min Operating Temperature: -55°C; Max Operating Temperature: 155°C; Resistance: 0R; Resistor Type: Thick Film; Packaging: Tape and Reel; Termination: SMD/SMT; Features: Moisture Resistant; Series: RC; Number of Terminations: 2; Length: 1mm; Width: 0.5mm; Height: 0.35mm; Radiation Hardening: No; Lead Free: Lead Free; RoHS Compliant: Yes; ComponentLink1URL: https://datasheet.ciiva.com/8896/pyu-rc0402-51-rohs-l-6-8896149.pdf?src-supplier=Avnet; ComponentLink1Description: https://datasheet.ciiva.com/8896/pyu-rc0402-51-rohs-l-6-8896149.pdf?src-supplier=Avnet; ComponentLink2URL: https://datasheet.ciiva.com/16790/pyu-rc0402-51-rohs-l-6-r-16790444.pdf?src-supplier=Future+Electronics; ComponentLink2Description: https://datasheet.ciiva.com/16790/pyu-rc0402-51-rohs-l-6-r-16790444.pdf?src-supplier=Future+Electronics; Supplier Part Number 1: 603-RC0402FR-070RL; LCSC Part Number: C106231
R117 R120 = RC0402FR-074K7L: RES 4.7K OHM 1% 1/16W 0402; Manufacturer: Yageo; Voltage Rating (DC): 50V; Power Rating: 62.5mW; Resistance: 4.7kR; Temperature Coefficient: 100ppm/°C; Max Power Dissipation: 63mW; Item Type: Resistor; Supplier 1: Avnet; Manufacturer Part Number: RC0402FR-074K7L; RoHS: Yes; Category: Chip SMD Resistors; Stock 1: 2420000; Pricing 1: 10000=0.00085 (USD); Case/Package: 0402; Number of Pins: 2; Case Code (Imperial): 0402; Case Code (Metric): 1005; Size Code: 0402; Min Operating Temperature: -55°C; Max Operating Temperature: 155°C; Tolerance: 1%; Voltage Rating: 50V; Packaging: Tape and Reel; Resistor Type: Thick Film; Termination: SMD/SMT; Features: Moisture Resistant; Series: RC; Number of Terminations: 2; Resistance Tolerance: 1%; Construction: Rectangular; Length: 1mm; Width: 0.5mm; Height: 0.32mm; Depth: 0.5mm; Height - Seated (Max): 0.016inch; RoHS Compliant: Yes; Reach SVHC Compliant: Yes; Military Standard: Not; Lead Free: Lead Free; ComponentLink1URL: https://datasheet.ciiva.com/22661/1686128-22661342.pdf?src-supplier=Element14; ComponentLink1Description: https://datasheet.ciiva.com/22661/1686128-22661342.pdf?src-supplier=Element14; ComponentLink2URL: https://datasheet.ciiva.com/7850/1018594-7850022.pdf?src-supplier=Element14; ComponentLink2Description: https://datasheet.ciiva.com/7850/1018594-7850022.pdf?src-supplier=Element14; ComponentLink3URL: https://datasheet.ciiva.com/7850/1018594-7850023.pdf?src-supplier=Element14; ComponentLink3Description: https://datasheet.ciiva.com/7850/1018594-7850023.pdf?src-supplier=Element14; ComponentLink4URL: https://datasheet.ciiva.com/15215/getdatasheetpartid-328119-15215035.pdf?src-supplier=Verical; ComponentLink4Description: https://datasheet.ciiva.com/15215/getdatasheetpartid-328119-15215035.pdf?src-supplier=Verical; Supplier Part Number 1: RC0402FR-074K7L; LCSC Part Number: C105871
R122 = RC0603FR-07120RL: RES 120 OHM 1% 1/10W 0603; Manufacturer: Yageo; Temperature Coefficient: 100ppm/°C; Voltage Rating (DC): 50V; Power Rating: 100mW; Item Type: Resistor; Supplier 1: Digi-Key; Manufacturer Part Number: RC0603FR-07120RL; RoHS: Yes; Category: Chip SMD Resistors; Stock 1: 839061; Pricing 1: 1=0.10000, 10=0.02400, 100=0.00970, 1000=0.00436, 2500=0.00378 (USD); Case/Package: 0603; Number of Pins: 2; Case Code (Metric): 1608; Case Code (Imperial): 0603; Size Code: 0603; Min Operating Temperature: -55°C; Max Operating Temperature: 155°C; Resistance: 120R; Tolerance: 1%; Resistor Type: Thick Film; Packaging: Tape and Reel; Voltage Rating: 50V; Package Quantity: 1; Number of Terminations: 2; Termination: SMD/SMT; Max Power Dissipation: 100mW; Features: Moisture Resistant; Series: RC; Construction: Rectangular; Resistance Tolerance: 1%; Length: 1.6mm; Width: 0.031inch; Height: 0.022inch; Depth: 0.8mm; REACH SVHC: No SVHC; Lead Free: Lead Free; Military Standard: Not; RoHS Compliant: Yes; ComponentLink1URL: https://datasheet.ciiva.com/2553/pyu-r-int-thick-7-2553512.pdf?src-supplier=Digi-Key; ComponentLink1Description: https://datasheet.ciiva.com/2553/pyu-r-int-thick-7-2553512.pdf?src-supplier=Digi-Key; ComponentLink2URL: https://datasheet.ciiva.com/7746/443971-7746248.pdf?src-supplier=Element14; ComponentLink2Description: https://datasheet.ciiva.com/7746/443971-7746248.pdf?src-supplier=Element14; ComponentLink3URL: https://datasheet.ciiva.com/2553/pyu-r-int-thick-7-2553513.pdf?src-supplier=Digi-Key; ComponentLink3Description: https://datasheet.ciiva.com/2553/pyu-r-int-thick-7-2553513.pdf?src-supplier=Digi-Key; ComponentLink4URL: https://datasheet.ciiva.com/7746/443971-7746249.pdf?src-supplier=Element14; ComponentLink4Description: https://datasheet.ciiva.com/7746/443971-7746249.pdf?src-supplier=Element14; ComponentLink5URL: https://datasheet.ciiva.com/2553/pyu-r-int-thick-7-2553514.pdf?src-supplier=Digi-Key; ComponentLink5Description: https://datasheet.ciiva.com/2553/pyu-r-int-thick-7-2553514.pdf?src-supplier=Digi-Key; ComponentLink6URL: https://datasheet.ciiva.com/46395/443971-46395021.pdf?src-supplier=Element14; ComponentLink6Description: https://datasheet.ciiva.com/46395/443971-46395021.pdf?src-supplier=Element14; Supplier Part Number 1: 311-120HRCT-ND; LCSC Part Number: C114640
R123 = RC0402FR-0710KL: RES 10K OHM 1% 1/16W 0402; Manufacturer: Yageo; Resistance: 10kR; Voltage Rating (DC): 50V; Temperature Coefficient: 100ppm/°C; Power Rating: 62.5mW; Max Power Dissipation: 63mW; Item Type: Resistor; Supplier 1: Mouser; Manufacturer Part Number: RC0402FR-0710KL; RoHS: Yes; Category: Chip SMD Resistors; Stock 1: 18648329; Pricing 1: 1=0.10000, 10=0.01400, 50=0.01400, 100=0.00500, 1000=0.00300, 10000=0.00200 (USD); Case/Package: 0402; Number of Pins: 2; Case Code (Imperial): 0402; Case Code (Metric): 1005; Min Operating Temperature: -55°C; Max Operating Temperature: 155°C; Resistor Type: Thick Film; Tolerance: 1%; Packaging: Tape and Reel; Voltage Rating: 50V; Termination: SMD/SMT; Working Voltage: 50V; Number of Terminations: 2; Features: Moisture Resistant; Series: RC; Resistance Tolerance: 1%; Construction: Rectangular; Length: 1mm; Width: 0.5mm; Height: 0.32mm; Depth: 0.5mm; Lead Pitch: 0.2mm; REACH SVHC: No SVHC; Lead Free: Lead Free; RoHS Compliant: Yes; Military Standard: Not; ComponentLink1URL: https://datasheet.ciiva.com/7660/38568-7660787.pdf?src-supplier=Element14; ComponentLink1Description: https://datasheet.ciiva.com/7660/38568-7660787.pdf?src-supplier=Element14; ComponentLink2URL: https://datasheet.ciiva.com/7849/1686128-7849814.pdf?src-supplier=Element14; ComponentLink2Description: https://datasheet.ciiva.com/7849/1686128-7849814.pdf?src-supplier=Element14; ComponentLink3URL: https://datasheet.ciiva.com/7983/1018594-7983486.pdf?src-supplier=Element14; ComponentLink3Description: https://datasheet.ciiva.com/7983/1018594-7983486.pdf?src-supplier=Element14; ComponentLink4URL: https://datasheet.ciiva.com/22747/1018594-22747512.pdf?src-supplier=Element14; ComponentLink4Description: https://datasheet.ciiva.com/22747/1018594-22747512.pdf?src-supplier=Element14; ComponentLink5URL: https://datasheet.ciiva.com/12667/pyu-rc0402-51-rohs-l-6-r-12667067.pdf?src-supplier=Mouser; ComponentLink5Description: https://datasheet.ciiva.com/12667/pyu-rc0402-51-rohs-l-6-r-12667067.pdf?src-supplier=Mouser; ComponentLink6URL: https://datasheet.ciiva.com/7849/1784430-7849813.pdf?src-supplier=Element14; ComponentLink6Description: https://datasheet.ciiva.com/7849/1784430-7849813.pdf?src-supplier=Element14; ComponentLink7URL: https://datasheet.ciiva.com/7849/1784430-7849815.pdf?src-supplier=Element14; ComponentLink7Description: https://datasheet.ciiva.com/7849/1784430-7849815.pdf?src-supplier=Element14; Supplier Part Number 1: 603-RC0402FR-0710KL; LCSC Part Number: C60490
U26 = SP3485EIM/TR: SOP-8 RS-485/RS-422 ICs ROHS; Manufacturer: HGSEMI; Item Type: IC; Manufacturer Part Number: SP3485EIM/TR; Package: SOP-8; LCSC Part Number: C519086; ComponentLink1Description: LCSC; ComponentLink1URL: https://www.lcsc.com/product-detail/RS-485-RS-422-ICs_HGSEMI-SP3485EIM-TR_C519086.html

## Nets that join several sheets
3V3: Power-Sheet (D5.2 F3.2 R12.1 TP3.1), Battery-Charging-Sheet (R50.1), Controller-Sheet (25 pins), Terminal-Sheet (F6.1), Digital-Input-Sheet (8 pins), Analog-Input-Sheet (C45.1 FB1.2), Ethernet-PoE-Sheet (C46.2 FB2.1 R124.1), RS485-Sheet (C78.1 R117.1 U26.8)
5V: Power-Sheet (7 pins), Controller-Sheet (C37.1 LED5.1 R37.2), Power-Relay-Sheet (12 pins), Terminal-Sheet (F5.1)
5V-OR: Power-Sheet (7 pins), Battery-Charging-Sheet (C42.1 R47.1 U11.1 U11.5)
24V-POE: Power-Sheet (Q2.2), Ethernet-PoE-Sheet (F7.2)
GND: Power-Sheet (70 pins), Battery-Charging-Sheet (11 pins), Controller-Sheet (43 pins), Power-Relay-Sheet (8 pins), Terminal-Sheet (7 pins), Digital-Input-Sheet (33 pins), Analog-Input-Sheet (14 pins), Ethernet-PoE-Sheet (53 pins), RS485-Sheet (6 pins)
VBAT: Power-Sheet (C24.2 L2.1 R16.1 U5.7), Battery-Charging-Sheet (7 pins)
VCC: Power-Sheet (10 pins), Terminal-Sheet (J13.1 J13.2 J13.3)
485_DE: Controller-Sheet (U9.14), RS485-Sheet (R123.1 U26.3)
485_RE: Controller-Sheet (U9.13), RS485-Sheet (U26.2)
ADC_RDY: Controller-Sheet (U9.11), Analog-Input-Sheet (U21.2)
BAT_ALERT: Battery-Charging-Sheet (R50.2 U12.5), Controller-Sheet (U9.10)
DI_1: Controller-Sheet (U8.39), Digital-Input-Sheet (R64.1 U13.4)
DI_2: Controller-Sheet (U8.38), Digital-Input-Sheet (R68.1 U15.4)
DI_3: Controller-Sheet (U8.4), Digital-Input-Sheet (R72.1 U17.4)
DI_4: Controller-Sheet (U8.5), Digital-Input-Sheet (R76.1 U19.4)
DI_5: Controller-Sheet (U8.6), Digital-Input-Sheet (R65.1 U14.4)
DI_6: Controller-Sheet (U8.7), Digital-Input-Sheet (R69.1 U16.4)
DI_7: Controller-Sheet (U8.17), Digital-Input-Sheet (R73.1 U18.4)
DI_8: Controller-Sheet (U8.18), Digital-Input-Sheet (R77.1 U20.4)
I2C_SCL: Battery-Charging-Sheet (U12.7), Controller-Sheet (5 pins), Analog-Input-Sheet (U21.10)
I2C_SDA: Battery-Charging-Sheet (U12.8), Controller-Sheet (5 pins), Analog-Input-Sheet (U21.9)
MCU_RX: Controller-Sheet (U8.31), RS485-Sheet (R115.1)
MCU_TX: Controller-Sheet (U8.23), RS485-Sheet (R119.1)
RELAY_1: Controller-Sheet (U9.4), Power-Relay-Sheet (R52.1)
RELAY_2: Controller-Sheet (U9.5), Power-Relay-Sheet (R53.1)
RELAY_3: Controller-Sheet (U9.6), Power-Relay-Sheet (R54.1)
RELAY_4: Controller-Sheet (U9.7), Power-Relay-Sheet (R55.1)
SPI_CS: Controller-Sheet (U8.32), Ethernet-PoE-Sheet (U22.32)
SPI_MISO: Controller-Sheet (U8.34), Ethernet-PoE-Sheet (U22.34)
SPI_MOSI: Controller-Sheet (U8.33), Ethernet-PoE-Sheet (U22.35)
SPI_SCLK: Controller-Sheet (U8.35), Ethernet-PoE-Sheet (U22.33)
TYPEC_N: Power-Sheet (U4.4), Controller-Sheet (U8.13)
TYPEC_P: Power-Sheet (U4.6), Controller-Sheet (U8.14)
W5500_INT: Controller-Sheet (U9.15), Ethernet-PoE-Sheet (R96.2 U22.36)
W5500_RST: Controller-Sheet (U9.16), Ethernet-PoE-Sheet (R98.2 U22.37)